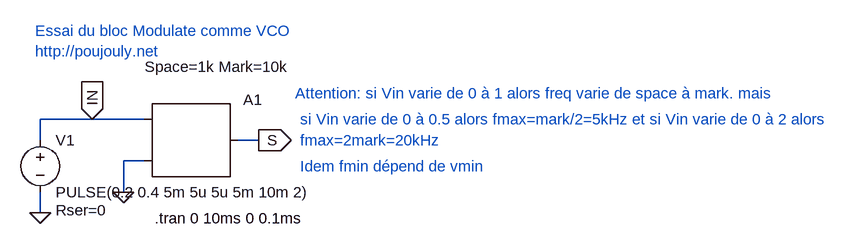
[diagram p0: schematic VCO.asc]
VCO.asc, the LTspice schematic file:
Version 4.1
SHEET 1 1340 680
WIRE 128 160 48 160
WIRE 208 160 128 160
WIRE 48 192 48 160
WIRE 384 192 352 192
WIRE 208 224 176 224
WIRE 176 272 176 224
WIRE 48 304 48 272
FLAG 384 192 S
IOPIN 384 192 Out
FLAG 48 304 0
FLAG 176 272 0
FLAG 128 160 IN
IOPIN 128 160 In
SYMBOL SpecialFunctions\\modulate 208 160 R0
WINDOW 3 1 -81 Left 2
SYMATTR Value Space=1k Mark=10k
SYMATTR InstName A1
SYMBOL voltage 48 176 R0
WINDOW 123 0 0 Left 0
WINDOW 39 24 124 Left 2
SYMATTR SpiceLine Rser=0
SYMATTR InstName V1
SYMATTR Value PULSE(0.2 0.4 5m 5u 5u 5m 10m 2)
TEXT 40 24 Left 2 ;Essai du bloc Modulate comme VCO\nhttp://poujouly.net
TEXT 224 312 Left 2 !.tran 0 10ms 0 0.1ms
TEXT 440 120 Left 2 ;Attention: si Vin varie de 0 à 1 alors freq varie de space à mark. mais
TEXT 448 160 Left 2 ;si Vin varie de 0 à 0.5 alors fmax=mark/2=5kHz et si Vin varie de 0 à 2 alors
TEXT 448 192 Left 2 ;fmax=2mark=20kHz
TEXT 448 232 Left 2 ;Idem fmin dépend de vmin

The netlist it stands for:
* VCO.asc
A1 IN 0 0 0 0 0 S 0 MODULATOR Space=1k Mark=10k
V1 IN 0 PULSE(0.2 0.4 5m 5u 5u 5m 10m 2) Rser=0
* Essai du bloc Modulate comme VCO
* http://poujouly.net
.tran 0 10ms 0 0.1ms
* Attention: si Vin varie de 0 à 1 alors freq varie de space à mark. mais
* si Vin varie de 0 à 0.5 alors fmax=mark/2=5kHz et si Vin varie de 0 à 2 alors
* fmax=2mark=20kHz
* Idem fmin dépend de vmin
.backanno
.end